# EAGLE design pager pcb (EAGLE 6.4)
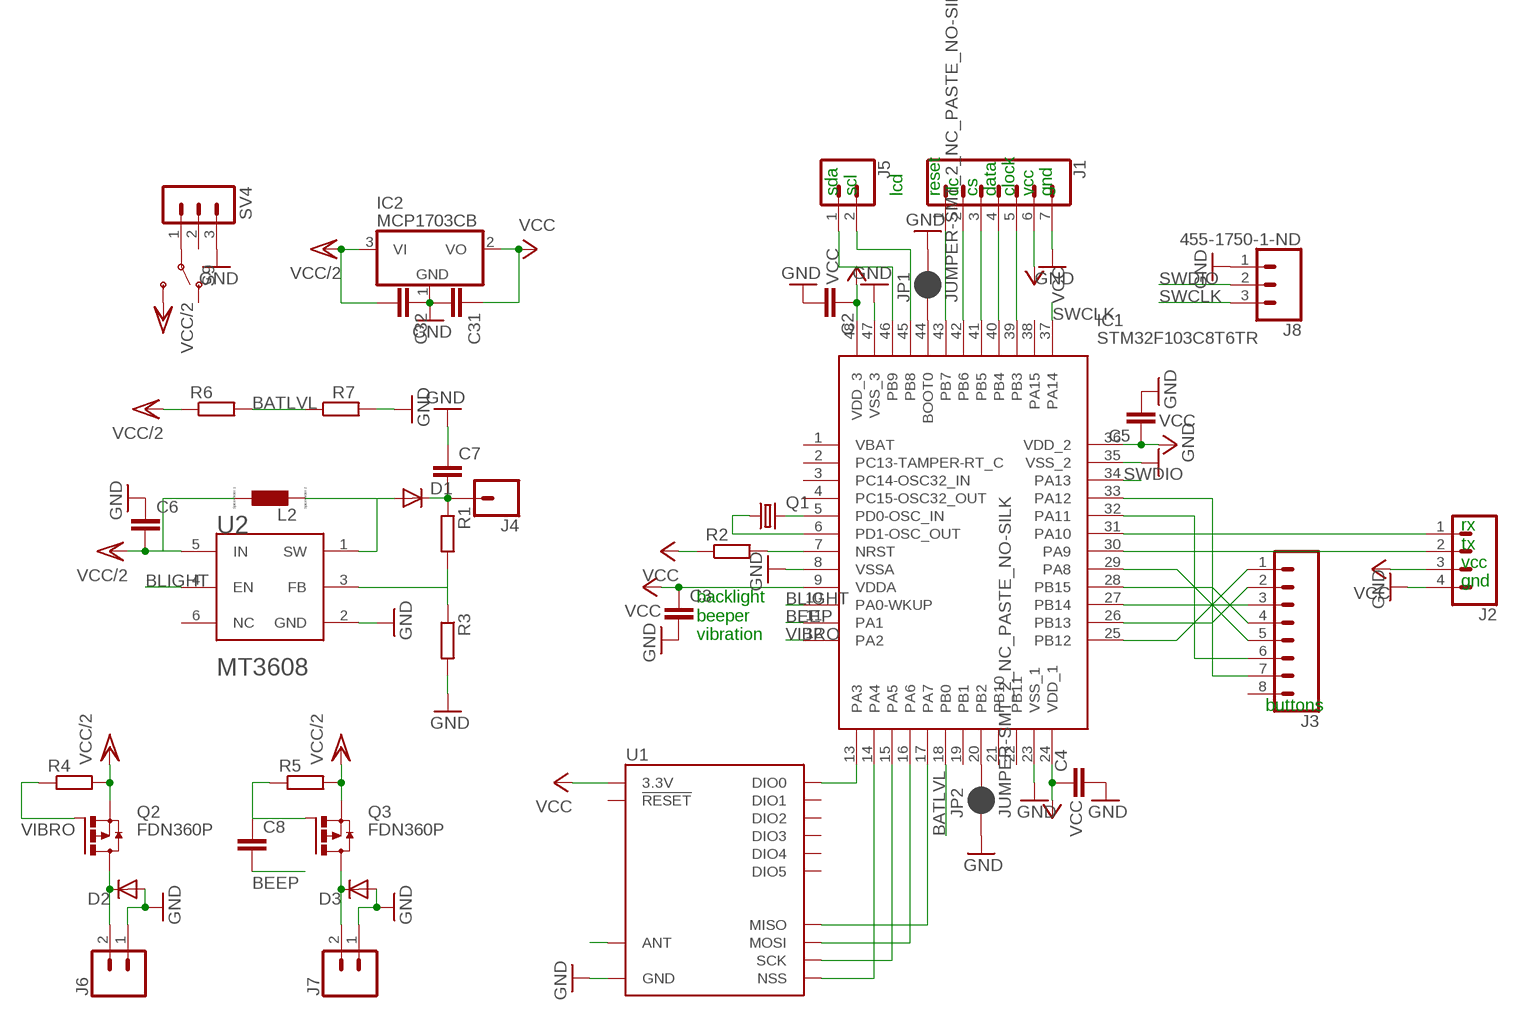
[diagram p0: schematic, sheet 1]

## Parts
C2  C-EUC0805  [C0805]
C3  C-EUC0805  [C0805]
C4  C-EUC0805  [C0805]
C5  C-EUC0805  [C0805]
C6  C-EUC0805  [C0805]
C7  C-EUC0805  [C0805]
C8  C-EUC0805  [C0805]
C31  C-EUC0805  [C0805]
C32  C-EUC0805  [C0805]
D1  DIODE-DO-214AC  [DO-214AC]
D2  DIODE-DO-214AC  [DO-214AC]
D3  DIODE-DO-214AC  [DO-214AC]
IC1  STM32F103C8T6TR  [QFP50P900X900X160-48N]
IC2  MCP1703CB  [SOT23]
J1  CONN_07  [1X07]
J2  CONN_04PTH  [1X04]
J3  CONN_08"  [1X08]
J4  CONN_01  [1X01]
J5  CONN_02  [1X02]
J6  CONN_02  [1X02]
J7  CONN_02  [1X02]
J8  455-1750-1-ND  CONN_03  [1X03]
JP1  JUMPER-SMT_2_NC_PASTE_NO-SILK  [SMT-JUMPER_2_NC_PASTE_NO-SILK]
JP2  JUMPER-SMT_2_NC_PASTE_NO-SILK  [SMT-JUMPER_2_NC_PASTE_NO-SILK]
L2  L0207/10  [0207/10]
Q1  CRYSTALCTS406  [CTS406]
Q2  FDN360P  [SUPER-SOT3]
Q3  FDN360P  [SUPER-SOT3]
R1  R-EU_M0805  [M0805]
R2  R-EU_M0805  [M0805]
R3  R-EU_M0805  [M0805]
R4  R-EU_M0805  [M0805]
R5  R-EU_M0805  [M0805]
R6  R-EU_M0805  [M0805]
R7  R-EU_M0805  [M0805]
S9  SWITCH-SPDT-SMD-RIGHT-ANGLE  [SWITCH_SPST_SMD_A]
SV4  MA03-1  [MA03-1]
U1  RFM95W  [RFM95/96/97/98W]
U2  AEROSEMI_TECHNOLOGY_CO.,_LTD_MT3608AEROSEMI_TECHNOLOGY_CO.,_LTD_MT3608_0_0  [AEROSEMI_TECHNOLOGY_CO.,_LTD_MT3608_0]

## Nets
BATLVL: IC1.18(PB0) R6.2 R7.1
BEEP: C8.2 IC1.11(PA1)
BLIGHT: IC1.10(PA0-WKUP) U2.4(EN)
GND: C2.2 C3.2 C4.2 C5.2 C6.1 C7.1 C31.2 C32.1 D2.A D3.A IC1.8(VSSA) IC1.23(VSS_1) IC1.35(VSS_2) IC1.47(VSS_3) IC2.1(GND) J1.7 J2.4 J6.1 J7.1 J8.1 JP1.2 JP2.1 R3.2 R7.2 SV4.3 U1.GND@1(GND) U1.GND@2(GND) U1.GND@3(GND) U2.2(GND)
N$1: IC1.5(PD0-OSC_IN) Q1.3
N$2: IC1.6(PD1-OSC_OUT) Q1.1
N$3: IC1.7(NRST) R2.2
N$4: IC1.44(BOOT0) JP1.1
N$5: IC1.20(PB2) JP2.2
N$6: IC1.43(PB7) J1.1
N$7: IC1.42(PB6) J1.2
N$8: IC1.41(PB5) J1.3
N$9: IC1.40(PB4) J1.4
N$10: IC1.39(PB3) J1.5
N$11: IC1.31(PA10) J2.1
N$12: IC1.30(PA9) J2.2
N$13: IC1.17(PA7) U1.MISO
N$14: IC1.16(PA6) U1.MOSI
N$15: IC1.15(PA5) U1.SCK
N$16: IC1.14(PA4) U1.NSS
N$17: IC1.13(PA3) U1.DIO0
N$18: IC1.25(PB12) J3.1
N$19: IC1.26(PB13) J3.2
N$20: IC1.27(PB14) J3.3
N$21: IC1.28(PB15) J3.4
N$22: IC1.29(PA8) J3.5
N$24: IC1.33(PA12) J3.7
N$25: IC1.32(PA11) J3.6
N$26: D2.C J6.2 Q2.3(D)
N$27: U1.ANT
N$28: D3.C J7.2 Q3.3(D)
N$29: IC1.46(PB9) J5.1
N$30: IC1.45(PB8) J5.2
N$31: S9.2(P) SV4.1
N$32: D1.A L2.2 U2.1(SW)
N$33: C7.2 D1.C J4.1 R1.1
N$34: C8.1 Q3.1(G) R5.1
N$36: R1.2 R3.1 U2.3(FB)
SWCLK: IC1.37(PA14) J8.3
SWDIO: IC1.34(PA13) J8.2
VCC: C2.1 C3.1 C4.1 C5.1 C31.1 IC1.9(VDDA) IC1.24(VDD_1) IC1.36(VDD_2) IC1.48(VDD_3) IC2.2(VO) J1.6 J2.3 R2.1 U1.3.3V
VCC/2: C6.2 C32.2 IC2.3(VI) L2.1 Q2.2(S) Q3.2(S) R4.2 R5.2 R6.1 S9.3(S) U2.5(IN)
VIBRO: IC1.12(PA2) Q2.1(G) R4.1
Unconnected: IC1.1(VBAT) IC1.2(PC13-TAMPER-RT_C) IC1.3(PC14-OSC32_IN) IC1.4(PC15-OSC32_OUT) IC1.19(PB1) IC1.21(PB10) IC1.22(PB11) IC1.38(PA15) J3.8 S9.1(O) SV4.2 U1.!RESET U1.DIO1 U1.DIO2 U1.DIO3 U1.DIO4 U1.DIO5 U2.6(NC)

## Notes on the sheet
- sda
  scl
- lcd
  
  reset
  dc
  cs
  data
  clock
  vcc
  gnd
- rx
  tx
  vcc
  gnd
- backlight
  beeper
  vibration
- buttons

## Library data of the parts
C2-C8 C31 C32 = resistor:C-EU: CAPACITOR, European symbol
D1-D3 = diode:DIODE-: DIODE
IC1 = SamacSys_Parts:STM32F103C8T6TR: ARM Microcontrollers - MCU 32BIT Cortex M3 USB 7 TIMERS 2 ADCS CAN Source: Datasheet <http://media.digikey.com/pdf/Data Sheets/ST Microelectronics PDFS/STM32F103x8,B.pdf>; DESCRIPTION: ARM Microcontrollers - MCU 32BIT Cortex M3 USB 7 TIMERS 2 ADCS CAN; HEIGHT: 1.6mm; MANUFACTURER_NAME: STMicroelectronics; MANUFACTURER_PART_NUMBER: STM32F103C8T6TR; MOUSER_PART_NUMBER: 511-STM32F103C8T6TR; MOUSER_PRICE-STOCK: https://www.mouser.co.uk/ProductDetail/STMicroelectronics/STM32F103C8T6TR?qs=5HwTSiuA5HDxFj62n06yag%3D%3D
IC2 = linear:MCP1703: 250 mA, 16V, Low Quiescent Current LDO Regulator Source: http://ww1.microchip.com/downloads/en/DeviceDoc/22049b.pdf
J1 = SparkFun-Connectors:CONN_07: Multi connection point. Often used as Generic Header-pin footprint for 0.1 inch spaced/style header connections On any of the 0.1 inch spaced packages, you can populate with these: Break Away Headers - Straight <https://www.sparkfun.com/products/116> (PRT-00116) Break Away Male Headers - Right Angle <https://www.sparkfun.com/products/553> (PRT-00553) Female Headers <https://www.sparkfun.com/products/115> (PRT-00115) Break Away Headers - Machine Pin <https://www.sparkfun.com/products/117> (PRT-00117) Break Away Female Headers - Swiss Machine Pin <https://www.sparkfun.com/products/743> (PRT-00743) For SCREWTERMINALS and SPRING TERMINALS visit here: Screw Terimnals on SparkFun.com <https://www.sparkfun.com/search/results?term=Screw+Terminals> (5mm/3.5mm/2.54mm spacing) This device is also useful as a general connection point to wire up your design to another part of your project. Our various solder wires solder well into these plated through hole pads. Hook-Up Wire - Assortment (Stranded, 22 AWG) <https://www.sparkfun.com/products/11375> (PRT-11375) Hook-Up Wire - Assortment (Solid Core, 22 AWG) <https://www.sparkfun.com/products/11367> (PRT-11367) View the entire wire category on our website here <https://www.sparkfun.com/categories/141> Special notes: Molex polarized connector foot print use with SKU : PRT-08231 with associated crimp pins and housings. 1MM SMD Version SKU: PRT-10208 NOTES ON THE VARIANTS LOCK and LOCK_LONGPADS... This footprint was designed to help hold the alignment of a through-hole component (i.e. 6-pin header) while soldering it into place. You may notice that each hole has been shifted either up or down by 0.005 of an inch from it's more standard position (which is a perfectly straight line). This slight alteration caused the pins (the squares in the middle) to touch the edges of the holes. Because they are alternating, it causes a "brace" to hold the component in place. 0.005 has proven to be the perfect amount of "off-center" position when using our standard breakaway headers. Although looks a little odd when you look at the bare footprint, once you have a header in there, the alteration is very hard to notice. Also,if you push a header all the way into place, it is covered up entirely on the bottom side.
J2 = SparkFun-Connectors:CONN_04: Multi connection point. Often used as Generic Header-pin footprint for 0.1 inch spaced/style header connections On any of the 0.1 inch spaced packages, you can populate with these: Break Away Headers - Straight <https://www.sparkfun.com/products/116> (PRT-00116) Break Away Male Headers - Right Angle <https://www.sparkfun.com/products/553> (PRT-00553) Female Headers <https://www.sparkfun.com/products/115> (PRT-00115) Break Away Headers - Machine Pin <https://www.sparkfun.com/products/117> (PRT-00117) Break Away Female Headers - Swiss Machine Pin <https://www.sparkfun.com/products/743> (PRT-00743) For SCREWTERMINALS and SPRING TERMINALS visit here: Screw Terimnals on SparkFun.com <https://www.sparkfun.com/search/results?term=Screw+Terminals> (5mm/3.5mm/2.54mm spacing) This device is also useful as a general connection point to wire up your design to another part of your project. Our various solder wires solder well into these plated through hole pads. Hook-Up Wire - Assortment (Stranded, 22 AWG) <https://www.sparkfun.com/products/11375> (PRT-11375) Hook-Up Wire - Assortment (Solid Core, 22 AWG) <https://www.sparkfun.com/products/11367> (PRT-11367) View the entire wire category on our website here <https://www.sparkfun.com/categories/141> Special notes: Molex polarized connector foot print use with SKU : PRT-08231 with associated crimp pins and housings. 1MM SMD Version SKU: PRT-10208; PROD_ID: CONN-09696
J3 = SparkFun-Connectors:CONN_08: Multi connection point. Often used as Generic Header-pin footprint for 0.1 inch spaced/style header connections On any of the 0.1 inch spaced packages, you can populate with these: Break Away Headers - Straight <https://www.sparkfun.com/products/116> (PRT-00116) Break Away Male Headers - Right Angle <https://www.sparkfun.com/products/553> (PRT-00553) Female Headers <https://www.sparkfun.com/products/115> (PRT-00115) Break Away Headers - Machine Pin <https://www.sparkfun.com/products/117> (PRT-00117) Break Away Female Headers - Swiss Machine Pin <https://www.sparkfun.com/products/743> (PRT-00743) Arduino Stackable Header - 8 Pin <https://www.sparkfun.com/products/9279> (PRT-09279) For SCREWTERMINALS and SPRING TERMINALS visit here: Screw Terimnals on SparkFun.com <https://www.sparkfun.com/search/results?term=Screw+Terminals> (5mm/3.5mm/2.54mm spacing) This device is also useful as a general connection point to wire up your design to another part of your project. Our various solder wires solder well into these plated through hole pads. Hook-Up Wire - Assortment (Stranded, 22 AWG) <https://www.sparkfun.com/products/11375> (PRT-11375) Hook-Up Wire - Assortment (Solid Core, 22 AWG) <https://www.sparkfun.com/products/11367> (PRT-11367) View the entire wire category on our website here <https://www.sparkfun.com/categories/141> Special notes: Molex polarized connector foot print use with SKU : PRT-08231 with associated crimp pins and housings. 1MM SMD Version SKU: PRT-10208 NOTES ON THE VARIANTS LOCK and LOCK_LONGPADS... This footprint was designed to help hold the alignment of a through-hole component (i.e. 6-pin header) while soldering it into place. You may notice that each hole has been shifted either up or down by 0.005 of an inch from it's more standard position (which is a perfectly straight line). This slight alteration caused the pins (the squares in the middle) to touch the edges of the holes. Because they are alternating, it causes a "brace" to hold the component in place. 0.005 has proven to be the perfect amount of "off-center" position when using our standard breakaway headers. Although looks a little odd when you look at the bare footprint, once you have a header in there, the alteration is very hard to notice. Also,if you push a header all the way into place, it is covered up entirely on the bottom side.; PROD_ID: CONN-08438
J4 = SparkFun-Connectors:CONN_01: Single connection point. Often used as Generic Header-pin footprint for 0.1 inch spaced/style header connections On any of the 0.1 inch spaced packages, you can populate with these: Break Away Headers - Straight <https://www.sparkfun.com/products/116> (PRT-00116) Break Away Male Headers - Right Angle <https://www.sparkfun.com/products/553> (PRT-00553) Female Headers <https://www.sparkfun.com/products/115> (PRT-00115) Break Away Headers - Machine Pin <https://www.sparkfun.com/products/117> (PRT-00117) Break Away Female Headers - Swiss Machine Pin <https://www.sparkfun.com/products/743> (PRT-00743) This device is also useful as a general connection point to wire up your design to another part of your project. Our various solder wires solder well into these plated through hole pads. Hook-Up Wire - Assortment (Stranded, 22 AWG) <https://www.sparkfun.com/products/11375> (PRT-11375) Hook-Up Wire - Assortment (Solid Core, 22 AWG) <https://www.sparkfun.com/products/11367> (PRT-11367) View the entire wire category on our website here <https://www.sparkfun.com/categories/141> Special notes: SMTSO-256-ET is a "flush mount" nut for a 4-40 screw. We mostly use this on specialty testbeds; it is a nice way to connect hardware to your PCB at an adjustable hieght. Also note, the SNAP packages are for using a snappable style connector. We sell a baggie of snaps and they are also used on two LilyPad designs: Snap Assortment - 30 pack (male and female) <https://www.sparkfun.com/products/11347> (DEV-11347) LilyPad Arduino SimpleSnap <https://www.sparkfun.com/products/10941> (DEV-10941) LilyPad SimpleSnap Protoboard <https://www.sparkfun.com/products/10940> (DEV-10940)
J5-J7 = SparkFun-Connectors:CONN_02: Multi connection point. Often used as Generic Header-pin footprint for 0.1 inch spaced/style header connections On any of the 0.1 inch spaced packages, you can populate with these: Break Away Headers - Straight <https://www.sparkfun.com/products/116> (PRT-00116) Break Away Male Headers - Right Angle <https://www.sparkfun.com/products/553> (PRT-00553) Female Headers <https://www.sparkfun.com/products/115> (PRT-00115) Break Away Headers - Machine Pin <https://www.sparkfun.com/products/117> (PRT-00117) Break Away Female Headers - Swiss Machine Pin <https://www.sparkfun.com/products/743> (PRT-00743) For SCREWTERMINALS and SPRING TERMINALS visit here: Screw Terimnals on SparkFun.com <https://www.sparkfun.com/search/results?term=Screw+Terminals> (5mm/3.5mm/2.54mm spacing) This device is also useful as a general connection point to wire up your design to another part of your project. Our various solder wires solder well into these plated through hole pads. Hook-Up Wire - Assortment (Stranded, 22 AWG) <https://www.sparkfun.com/products/11375> (PRT-11375) Hook-Up Wire - Assortment (Solid Core, 22 AWG) <https://www.sparkfun.com/products/11367> (PRT-11367) View the entire wire category on our website here <https://www.sparkfun.com/categories/141> Special notes: Molex polarized connector foot print use with: PRT-08233 with associated crimp pins and housings. 2.54_SCREWTERM for use with PRT-10571. 3.5mm Screw Terminal footprints for PRT-08084 5mm Screw Terminal footprints for use with PRT-08432
J8 = SparkFun-Connectors:CONN_03: Multi connection point. Often used as Generic Header-pin footprint for 0.1 inch spaced/style header connections On any of the 0.1 inch spaced packages, you can populate with these: Break Away Headers - Straight <https://www.sparkfun.com/products/116> (PRT-00116) Break Away Male Headers - Right Angle <https://www.sparkfun.com/products/553> (PRT-00553) Female Headers <https://www.sparkfun.com/products/115> (PRT-00115) Break Away Headers - Machine Pin <https://www.sparkfun.com/products/117> (PRT-00117) Break Away Female Headers - Swiss Machine Pin <https://www.sparkfun.com/products/743> (PRT-00743) Stackable Header - 3 Pin (Female, 0.1") <https://www.sparkfun.com/products/13875> (PRT-13875) For SCREWTERMINALS and SPRING TERMINALS visit here: Screw Terimnals on SparkFun.com <https://www.sparkfun.com/search/results?term=Screw+Terminals> (5mm/3.5mm/2.54mm spacing) This device is also useful as a general connection point to wire up your design to another part of your project. Our various solder wires solder well into these plated through hole pads. Hook-Up Wire - Assortment (Stranded, 22 AWG) <https://www.sparkfun.com/products/11375> (PRT-11375) Hook-Up Wire - Assortment (Solid Core, 22 AWG) <https://www.sparkfun.com/products/11367> (PRT-11367) View the entire wire category on our website here <https://www.sparkfun.com/categories/141> Special notes: Molex polarized connector foot print use with SKU : PRT-08232 with associated crimp pins and housings.; PROD_ID: XXX-00000
JP1 JP2 = SparkFun-Jumpers:JUMPER-SMT_2_NC_PASTE: Normally closed solder jumper This jumper has an aperture in the stencil to allow solder paste to bridge the split in the wire so it's normally closed (NC). Wick off the solder to open the connection. Reapply solder to reclose the connection.
L2 = eagle-ltspice:L: INDUCTOR, European symbol; SPICEMODEL: NONE; SPICEPREFIX: L
Q1 = crystal:CRYSTAL: CRYSTAL; OC_FARNELL: unknown; OC_NEWARK: unknown
Q2 Q3 = transistor-power:FDN360P: Single P-Channel, PowerTrench (R) MOSFET Source: http://www.fairchildsemi.com/ds/FD/FDN360P.pdf
R1-R7 = rcl:R-EU_: RESISTOR, European symbol
S9 = SparkFun-Switches:SWITCH-SPDT: Single Pole, Double Throw (SPDT) Switch Single-pole, double-throw (SPDT) switch. Variant Overview SMD-AYZ0202 Surface Mount DPDT Switch <https://www.sparkfun.com/products/597> (COM-00597) Used on e.g. LilyPad Arduino USB - ATmega32U4 Board <https://www.sparkfun.com/products/12049> PTH-11.6X4.0MM SPDT Mini Power Switch <https://www.sparkfun.com/products/102> (COM-00102) Used on e.g. SparkFun Simon Says - Through-Hole Soldering Kit <https://www.sparkfun.com/products/10547> (KIT-10547) PTH-11.6X4.0MM-KIT KIT version of SPDT Mini Power Switch - Simplifies soldering by removing tStop of switch pins - only one side can be soldered. PTH-11.6X4.0MM-LOCK LOCK version of SPDT Mini Power Switch - Offset pins hold switch in place for easier soldering. SMD-RIGHT-ANGLE Surface Mount Right Angle Switch <https://www.sparkfun.com/products/10860> (COM-10860) Used on e.g. SparkFun ESP8266 Thing <https://www.sparkfun.com/products/13231>; PROD_ID: SWCH-10651; SF_SKU: COM-10860
SV4 = con-lstb:MA03-1: PIN HEADER; OC_FARNELL: unknown; OC_NEWARK: unknown
U1 = SparkFun-RF:RFM95W: RFM95/96/97/98 The RFM95/96/97/98(W) transceivers feature the LoRaTM long range modem that provides ultra-long range spread spectrum communication and high interference immunity whilst minimising current consumption. These devices also support high performance (G)FSK modes for systems including WMBus, IEEE802.15.4g. The RFM95/96/97/98(W) deliver exceptional phase noise, selectivity, receiver linearity and IIP3 for significantly lower current consumption than competing devices Datasheet <http://www.hoperf.com/upload/rf/RFM95_96_97_98W.pdf>; PROD_ID: IC-13959
U2 = Aerosemi Technology Co., Ltd - MT3608:AEROSEMI_TECHNOLOGY_CO.,_LTD_MT3608: High Efficiency 1.2MHz 2A Step Up Converter; CENTROID_NOT_SPECIFIED: No; DATASHEET: https://www.olimex.com/Products/Breadboarding/BB-PWR-3608/resources/MT3608.pdf; DEVICE_CLASS_L1: Integrated Circuits (ICs); DEVICE_CLASS_L2: Power Management ICs; DEVICE_CLASS_L3: Voltage Regulators - Switching; HEIGHT: 1.45mm; MAX_DUTY_CYCLE: 90%; MAX_JUNCTION_TEMP: +160°C; MAX_SUPPLY_VOLTAGE: 24V; MF: Aerosemi Technology Co., Ltd; MFG_PACKAGE_IDENT: MT3608; MFG_PACKAGE_IDENT_DATE: 0; MFG_PACKAGE_IDENT_REV: 0; MIN_SUPPLY_VOLTAGE: 2V; MPN: MT3608; NUMBER_OF_OUTPUTS: 1; OUTPUT_CURRENT: 2A; PACKAGE: SOT23-6; PREFIX: U; STANDOFF_HEIGHT: 0mm; SWITCHING_FREQUENCY: 1.2MHz; SWITCHING_TOPOLOGY: Boost; TEMPERATURE_RANGE_HIGH: +85°C; TEMPERATURE_RANGE_LOW: -40°C; VERIFICATION_VERSION: 0.0.0.1

## Board
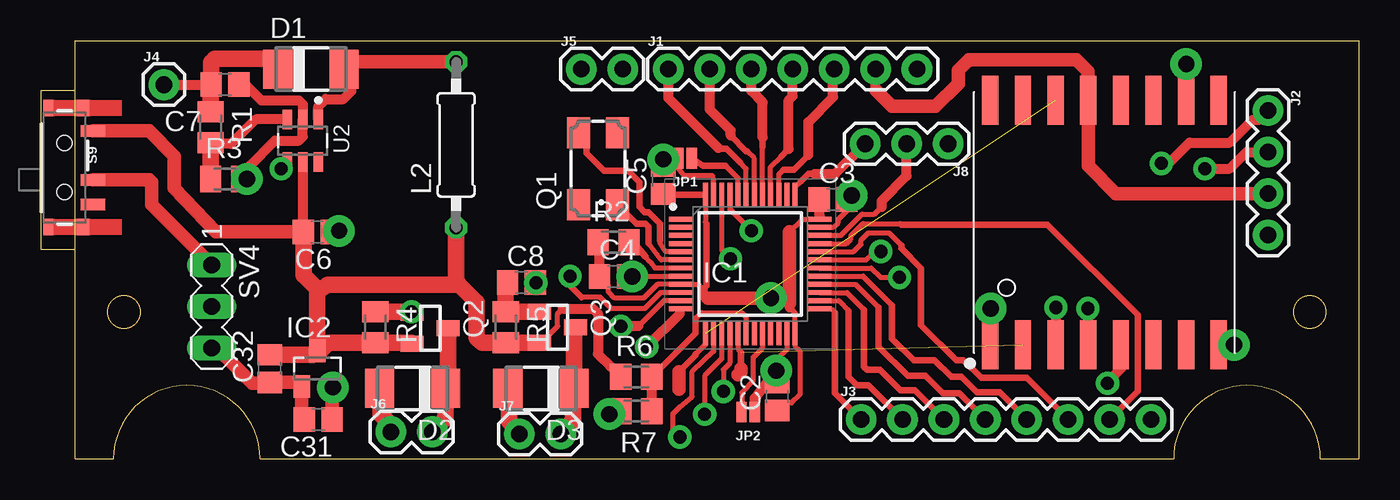
[diagram p1: board, top side]
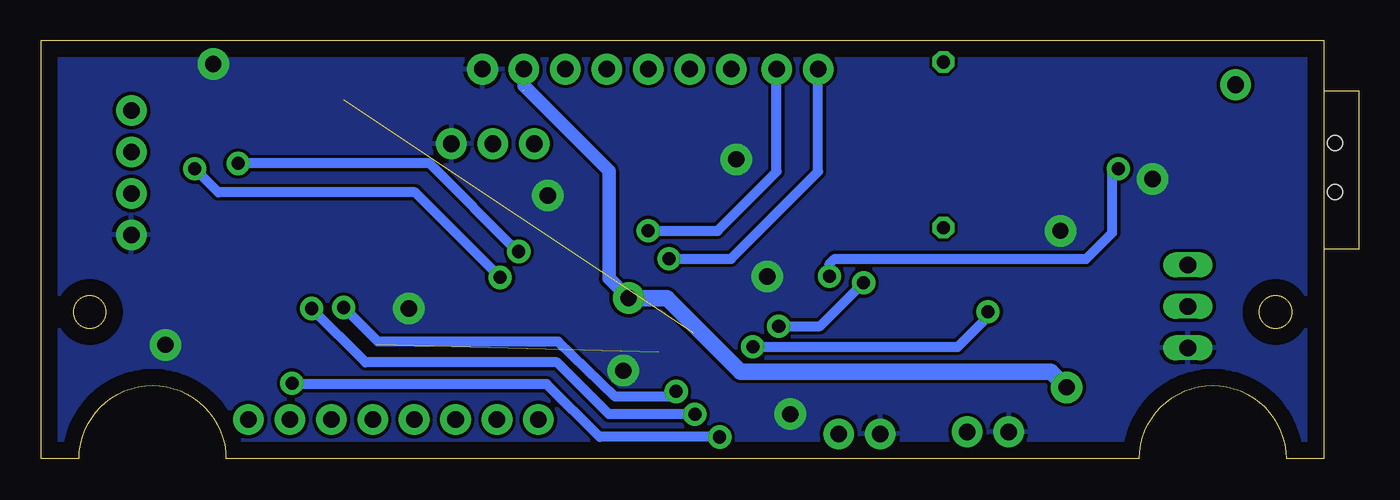
[diagram p2: board, bottom side, seen from below]

Size 80.8 x 25.62 mm. Coordinates in mm from the lower left corner, seen from the top.
Outline: 2.1,22.55 0,22.55 0,12.83 2.1,12.83
Outline: 2.1,0 4.45,0 arc-180 13.45,0 69.45,0 arc-180 78.45,0 80.8,0 80.8,25.62 2.1,25.62 2.1,0
Outline: circle at 5.1,9 radius 1
Outline: circle at 77.8,9 radius 1
Copper layers (1*16): Top 0.035mm / dielectric 1.5mm / Bottom 0.035mm
Design rules "default": minimum track width 10mil, minimum drill 24mil, track to track 8mil, track to pad 8mil, pad to pad 8mil, via to via 8mil, smd to smd 8mil, copper to edge 40mil, drill to drill 8mil, minimum pad ring 10mil, minimum via ring 8mil, stop-mask expansion 4mil, vias tented up to drill 0mil, thermal gap 10mil

### Footprints (pad centres in the part's own frame; a part is rotated, then mirrored left to right if it is on the bottom)
C0805 = smd 1.3 x 1.5: 1 -0.85,0; 2 0.85,0
DO-214AC = smd 1.8 x 2.4: A 2.025,0; C -2.025,0
QFP50P900X900X160-48N = smd 1.475 x 0.3: 1 -4.238,2.75; 2 -4.238,2.25; 3 -4.238,1.75; 4 -4.238,1.25; 5 -4.238,0.75; 6 -4.238,0.25; 7 -4.238,-0.25; 8 -4.238,-0.75; 9 -4.238,-1.25; 10 -4.238,-1.75; 11 -4.238,-2.25; 12 -4.238,-2.75; 25 4.238,-2.75; 26 4.238,-2.25; 27 4.238,-1.75; 28 4.238,-1.25; 29 4.238,-0.75; 30 4.238,-0.25; 31 4.238,0.25; 32 4.238,0.75; 33 4.238,1.25; 34 4.238,1.75; 35 4.238,2.25; 36 4.238,2.75 | smd 0.3 x 1.475: 13 -2.75,-4.238; 14 -2.25,-4.238; 15 -1.75,-4.238; 16 -1.25,-4.238; 17 -0.75,-4.238; 18 -0.25,-4.238; 19 0.25,-4.238; 20 0.75,-4.238; 21 1.25,-4.238; 22 1.75,-4.238; 23 2.25,-4.238; 24 2.75,-4.238; 37 2.75,4.238; 38 2.25,4.238; 39 1.75,4.238; 40 1.25,4.238; 41 0.75,4.238; 42 0.25,4.238; 43 -0.25,4.238; 44 -0.75,4.238; 45 -1.25,4.238; 46 -1.75,4.238; 47 -2.25,4.238; 48 -2.75,4.238
SOT23 = smd 1 x 1.4: 1 -0.95,-1.1; 2 0.95,-1.1; 3 0,1.1
1X07 = drill 1.016 pad 1.88: 1 0,0; 2 2.54,0; 3 5.08,0; 4 7.62,0; 5 10.16,0; 6 12.7,0; 7 15.24,0
1X04 = drill 1.016 pad 1.88: 1 0,0; 2 2.54,0; 3 5.08,0; 4 7.62,0
1X08 = drill 1.016 pad 1.88: 1 0,0; 2 2.54,0; 3 5.08,0; 4 7.62,0; 5 10.16,0; 6 12.7,0; 7 15.24,0; 8 17.78,0
1X01 = drill 1.016 pad 1.88: 1 0,0
1X02 = drill 1.016 pad 1.88: 1 0,0; 2 2.54,0
1X03 = drill 1.016 pad 1.88: 1 0,0; 2 2.54,0; 3 5.08,0
SMT-JUMPER_2_NC_PASTE_NO-SILK = smd 0.635 x 1.27: 1 -0.406,0; 2 0.406,0
0207/10 = drill 0.813 octagon: 1 -5.08,0; 2 5.08,0
CTS406 = smd 1.9 x 1.4: 1 -2.2,-1.2; 2 2.2,-1.2; 3 2.2,1.2; 4 -2.2,1.2
SUPER-SOT3 = smd 1 x 1.4: 1 -0.95,-1.1; 2 0.95,-1.1; 3 0,1.1
M0805 = smd 1.3 x 1.6: 1 -0.95,0; 2 0.95,0
SWITCH_SPST_SMD_A = smd 0.7 x 1.5: 1 -2.25,-1.75; 2 -0.75,-1.75; 3 2.25,-1.75 | smd 1 x 0.6: GND1 -3.65,1; GND3 3.65,1 | smd 1 x 0.8: GND2 -3.65,-1.1; GND4 3.65,-1.1 | hole 0.9: -1.5,0; 1.5,0
MA03-1 = drill 1.016 long: 1 -2.54,0; 2 0,0; 3 2.54,0
RFM95/96/97/98W = smd 3 x 1: 3.3V 7.5,1; !RESET -7.5,-3; ANT 7.5,-7; DIO0 7.5,3; DIO1 7.5,5; DIO2 7.5,7; DIO3 7.5,-3; DIO4 7.5,-1; DIO5 -7.5,-5; GND@1 -7.5,7; GND@2 -7.5,-7; GND@3 7.5,-5; MISO -7.5,5; MOSI -7.5,3; NSS -7.5,-1; SCK -7.5,1
AEROSEMI_TECHNOLOGY_CO.,_LTD_MT3608_0 = smd 0.6 x 1.2: 1 -0.95,-1.3; 2 0,-1.3; 3 0.95,-1.3; 4 0.95,1.3; 5 0,1.3; 6 -0.95,1.3

### Placement (x,y rotation side)
C2  45.15,3.81 90 top
C3  48.58,15.88 0 top
C4  35.12,11.18 0 top
C5  38.16,17.09 90 top
C6  16.95,13.91 180 top
C7  11.3,22.93 180 top
C8  29.46,10.8 0 top
C31  17.02,2.42 180 top
C32  14.03,5.53 90 top
D1  16.57,23.88 0 top
D2  22.8,4.32 180 top
D3  30.67,4.32 180 top
IC1  43.5,11.94 0 top
IC2  16.95,5.53 0 top
J1  38.48,23.88 0 top
J2  75.25,21.34 270 top
J3  50.29,2.42 0 top
J4  7.56,22.93 0 top
J5  33.15,23.88 0 top
J6  21.46,1.66 0 top
J7  29.34,1.53 0 top
J8  55.63,19.31 180 top
JP1  39.5,18.42 180 top
JP2  43.37,2.86 180 top
L2  25.46,19.24 90 top
Q1  34.16,17.78 90 top
Q2  23.88,8.01 270 top
Q3  31.69,8.07 270 top
R1  10.41,20.32 270 top
R2  35.12,13.28 0 top
R3  11.37,17.15 0 top
R4  20.51,8.07 270 top
R5  28.51,8.07 270 top
R6  36.51,5.02 0 top
R7  36.51,2.93 180 top
S9  1.46,17.85 90 top
SV4  10.48,9.34 270 top
U1  65.21,14.48 90 top
U2  16.07,19.5 180 top

### Tracks (layer width: path | path; a pad name or v marks a point on that pad's centre or on a via)
BATLVL
  Top 0.305: IC1.18 43.24,8.7 42.99,8.96 40.51,8.96 40.13,8.58
  Top 0.406: 40.13,8.58 40.13,7.69 R6.2
  Top 0.61: R7.1 R6.2
BEEP  (via drill 0.8 pad 1.42)
  Top 0.305: IC1.11 38.2,9.69 36.64,8.13
  Top 0.61: 36.64,8.13 v35.56,8.13 | v30.35,10.8 30.35,10.76 C8.2
  Bottom 0.61: v35.56,8.13 33.02,8.13 v30.35,10.8
BLIGHT  (via drill 0.8 pad 1.42)
  Top 0.305: IC1.10 38,10.19 37.02,9.21 34.99,9.21 34.29,9.91 33.15,9.91
  Top 0.406: 33.15,9.91 32.45,10.61 v32.45,11.18
  Top 0.61: v14.73,17.78 14.86,17.94 U2.4
  Bottom 0.61: v32.45,11.18 32.45,11.94 32.13,12.26 16.7,12.26 15.11,13.85 15.11,17.53 v14.73,17.78
GND  (via drill 1 pad 1.93)
  Top 0.305: v36.26,11.18 39.25,11.18 IC1.8 | IC1.23 45.75,6.7 45.15,6.1 45.15,5.66 v45.09,5.4 | IC1.35 48.6,14.19 48.89,14.48 48.89,14.67 49.53,15.31 49.53,15.6 C3.2 | IC1.47 41.25,17.11 41.21,17.34 39.46,17.34 38.99,17.94
  Top 0.406: C5.2 38.99,17.94 39.07,17.94 JP1.2
  Top 0.61: v12.64,17.15 12.83,17.98 14.35,19.5 15.81,19.5 16.07,19.75 U2.2 16.07,21.72 15.81,21.98 13.53,21.98 12.57,22.93 C7.1 | v36.26,11.18 C4.2 | JP2.1 43.78,3.71 v45.09,5.4 | U1.GND@1 58.21,9.2 v58.23,9.21 | U1.GND@2 v73.15,6.98 v73.15,6.99 | v49.72,16.13 C3.2 | C5.2 v38.16,18.36
  Top 0.813: R3.2 v12.64,17.15 | C6.1 v18.29,13.97 | SV4.3 10.79,6.8 12.95,4.64 13.99,4.64 C32.1 15.75,4.68 IC2.1 16,2.58 C31.2 | R7.2 35.05,2.93 v34.86,2.73 | v45.09,5.4 C2.2
  Top 1.016: J6.1 21.46,2.1 20.83,2.73 20.83,4.27 D2.A | J7.1 29.34,1.66 28.7,2.29 28.7,4.27 D3.A | U1.GND@3 70.21,24.18 v70.23,24.2
  pour Bottom: 1.65,26.17 81.41,26.17 81.41,-0.44 1.65,-0.44
N$1
  Top 0.305: IC1.5 38.3,12.69 37.97,13.21 37.97,13.4
  Top 0.406: 37.97,13.4 37.97,14.42 37.27,15.12 37.02,15.12 36.7,15.44 36.7,16.96 36.01,17.66 34.54,17.66 33.46,18.74 33.46,19.48 Q1.3
N$2
  Top 0.305: IC1.6 38.04,12.19 37.78,12.51 37.27,13.21
  Top 0.406: 37.27,13.21 37.27,14.23 37.08,14.42 36.53,14.42 Q1.1
N$3
  Top 0.305: IC1.7 37.65,11.69 37.46,11.94 37.27,12.13 37.08,12.39
  Top 0.406: 37.08,12.39 36.58,12.96 36.38,12.96 R2.2
N$4
  Top 0.305: IC1.44 42.75,17.2 41.97,17.98
  Top 0.406: 41.97,17.98 40.6,17.98 JP1.1
N$5
  Top 0.305: IC1.20 44.25,6.79 43.69,6.23 43.69,4.83 42.99,4.07 42.99,2.89 JP2.2
N$6
  Top 0.305: IC1.43 43.25,17.78 42.86,18.16
  Top 0.406: 42.86,18.16 42.04,18.99 41.59,18.99 41.53,19.05
  Top 0.61: 41.53,19.05 38.48,22.1 J1.1
N$7
  Top 0.305: IC1.42 43.75,18.42 43.31,18.86
  Top 0.406: 43.31,18.86 43.24,18.86 42.29,19.82
  Top 0.61: 42.29,19.82 42.29,20.13 41.02,21.4 J1.2
N$8
  Top 0.305: IC1.41 44.25,19.11 44.26,19.12
  Top 0.406: 44.26,19.12 44.26,19.69
  Top 0.61: 44.26,19.69 44.26,21.85 43.56,22.55 J1.3
N$9
  Top 0.305: IC1.40 44.75,17.89 45.4,18.55
  Top 0.406: 45.4,18.55 45.85,18.99
  Top 0.61: 45.85,18.99 45.85,21.98 46.1,22.23 J1.4
N$10
  Top 0.305: IC1.39 45.25,17.44 45.53,17.72
  Top 0.406: 45.53,17.72 46.16,17.72 47.05,18.61
  Top 0.61: 47.05,18.61 47.05,20.64 48.58,22.17 48.58,23.82 J1.5
N$11  (via drill 0.8 pad 1.42)
  Top 0.305: IC1.31 50.6,12.19 50.99,12.58 51.24,12.58 v51.5,12.71
  Top 0.61: v68.71,18.1 69.15,18.1 70.42,19.37 72.9,19.37 74.3,20.77 74.68,20.77 J2.1
  Bottom 0.61: v51.5,12.71 51.56,12.71 56.96,18.1 v68.71,18.1
N$12  (via drill 0.8 pad 1.42)
  Top 0.305: IC1.30 50.92,11.69 51.5,11.12 v52.64,11.12
  Top 0.61: J2.2 73.91,18.8 72.9,17.78 v71.37,17.78
  Bottom 0.61: v52.64,11.12 57.85,16.32 69.91,16.32 v71.37,17.78
N$13  (1 unrouted)
  Top 0.305: IC1.17 42.75,6.72 42.93,6.54
  Top 0.406: 42.93,6.54 42.93,5.53
  Top 0.813: 42.93,5.53 42.93,5.34 42.74,5.15
N$14  (via drill 0.8 pad 1.42)
  Top 0.305: IC1.16 42.25,5.87 41.85,5.47 v41.85,4.13
  Top 0.61: v62.23,9.28 62.23,7 U1.MOSI
  Bottom 0.61: v41.85,4.13 41.97,3.81 45.59,3.81 49.09,7.18 60.13,7.18 v62.23,9.28
N$15  (via drill 0.8 pad 1.42)
  Top 0.305: IC1.15 41.75,6.13 40.7,5.08 v40.7,2.73
  Top 0.61: v64.2,9.21 64.2,7 U1.SCK
  Bottom 0.61: v40.7,2.73 45.97,2.73 49.15,5.91 60.9,5.91 v64.2,9.21
N$16  (via drill 0.8 pad 1.42)
  Top 0.305: IC1.14 41.25,6.58 39.94,5.34 39.94,3.81 39.18,3.18 38.73,2.73 38.73,1.78 v39.18,1.34
  Top 0.61: v65.41,4.64 65.41,4.7 66.23,5.53 66.23,6.97 U1.NSS
  Bottom 0.61: v39.18,1.34 46.55,1.34 49.78,4.58 65.34,4.58 v65.41,4.64
N$17  (1 unrouted)
  Top 0.305: IC1.13 40.75,6.97 40.68,6.97 40.13,6.42
  Top 0.406: 40.13,6.42 40.13,6.35 39.12,5.34
  Top 0.813: 39.12,5.34 39.12,4.26
N$18
  Top 0.305: IC1.25 48.47,9.19 48.7,8.96
  Top 0.406: 48.7,8.96 48.7,4.01 J3.1
N$19
  Top 0.305: IC1.26 48.92,9.69 49.53,9.08
  Top 0.406: 49.53,9.08 49.53,5.02 50.04,4.51 50.74,4.51 J3.2
N$20
  Top 0.305: IC1.27 49.44,10.19 50.48,9.15
  Top 0.406: 50.48,9.15 50.48,5.66 50.67,5.47 51.44,5.47 52.7,4.2 53.59,4.2 J3.3
N$21
  Top 0.305: IC1.28 49.95,10.69 51.37,9.28
  Top 0.406: 51.37,9.28 51.37,6.86 53.15,5.08 54.23,5.08 55.31,4.01 56.32,4.01 J3.4
N$22
  Top 0.305: IC1.29 50.41,11.19 52.2,9.4
  Top 0.406: 52.2,9.4 52.2,7.37 53.53,6.04 54.8,6.04 55.82,5.02 56.45,5.02 57.4,4.07 58.8,4.07 J3.5
N$24
  Top 0.305: IC1.33 49.38,13.19 49.66,13.47 49.66,13.66 50.42,14.42 52.7,14.42 52.77,14.36
  Top 0.406: 52.77,14.36 61.72,14.36 67.25,8.83 67.25,4.13 J3.7
N$25
  Top 0.305: IC1.32 49.84,12.69 50.29,13.15 50.29,13.4 50.74,13.85 52.01,13.85 52.77,13.09
  Top 0.406: J3.6 60.45,4.96 57.66,4.96 56.58,6.04 56.13,6.04 53.98,8.2 53.98,11.69 52.77,12.9 52.77,13.09
N$26
  Top 1.016: J6.2 24.83,2.48 D2.C 24.98,4.48 Q2.3
N$28
  Top 1.016: J7.2 31.88,1.59 32.64,2.35 32.64,4.27 D3.C 32.7,7.98 Q3.3
N$29  (via drill 0.8 pad 1.42)
  Top 0.305: IC1.46 41.75,12.8 v42.29,12.26
  Bottom 0.61: v42.29,12.26 38.48,12.26 33.15,17.59 J5.1
N$30  (via drill 0.8 pad 1.42)
  Top 0.305: IC1.45 42.25,15.29 v43.56,13.97
  Bottom 0.61: v43.56,13.97 39.31,13.97 35.69,17.59 J5.2
N$31
  Top 0.813: S9.2 6.66,17.1 6.8,16.96 6.8,15.56 SV4.1
N$32
  Top 0.61: U2.1 17.02,21.59 17.46,22.04 18.54,22.04 19.05,22.55 19.05,23.32 D1.A
  Top 0.813: D1.A 18.8,24.33 L2.2
N$33
  Top 0.61: J4.1 C7.2
  Top 1.016: R1.1 10.41,22.89 C7.2 10.45,24.3 10.67,24.52 14.93,24.52 D1.C
N$34
  Top 1.016: Q3.1 R5.1 28.51,10.7 C8.1
N$36
  Top 0.61: U2.3 13.17,20.8 11.68,19.31 10.48,19.31 R1.2
  Top 1.016: R3.1 R1.2
SWCLK
  Top 0.305: IC1.37 46.25,16.66 46.61,17.02
  Top 0.406: 46.61,17.02 47.05,17.47 47.44,17.47
  Top 0.61: 47.44,17.47 48.7,17.47 J8.3
SWDIO
  Top 0.305: IC1.34 49.06,13.69 50.35,14.99 51.12,14.99 51.56,15.44
  Top 0.61: 51.56,15.44 51.56,15.82 53.09,17.34 J8.2
VCC  (via drill 0.8 pad 1.42, 1 pad 1.93)  (1 unrouted)
  Top 0.305: C4.1 34.8,10.65 34.8,10.23 35.18,9.85 36.96,9.85 37.8,10.69 IC1.9 40.34,10.69 40.34,10.59 40.58,10.35 | C2.1 45.17,3.43 46.04,3.43 46.55,3.94 46.55,6.61 46.25,6.91 IC1.24 46.25,8.94 45.91,9.28 | 45.91,13.91 46.69,14.69 IC1.36 47.74,14.91 47.75,14.93 | 40.58,16.2 40.59,16.18 IC1.48 40.75,14.5 40.83,14.42
  Top 0.406: 40.58,16.2 38.2,16.2 C5.1 | 40.83,14.42 40.83,10.61 40.58,10.35
  Top 0.61: C4.1 34.27,13.18 R2.1 | 45.91,9.28 45.91,9.53 45.78,9.85 | 47.75,14.93 47.75,15.52 C3.1 | 40.58,10.35 40.58,10.04 40.89,9.85 | 51.18,22.55 J1.6
  Top 0.813: C31.1 17.87,4.39 IC2.2 | 45.91,9.53 45.91,13.91 | 40.89,9.85 v44.77,9.85 45.78,9.85 | 51.24,22.55 52.2,21.59 54.86,21.59 56.26,22.99 56.26,23.82 56.9,24.45 63.5,24.45 64.2,23.75 64.2,22 U1.3.3V 64.21,17.96 65.91,16.26 J2.3
  Top 1.016: IC2.2 v17.91,4.39
  Bottom 0.813: J1.6 51.18,22.86 45.97,17.66 45.97,11.05 v44.77,9.85
  Bottom 1.016: v17.91,4.39 18.86,5.34 37.91,5.34 42.42,9.85 v44.77,9.85
  other vias: 51.18,23.88
VCC/2
  Top 0.305: Q3.2 30.67,7.12 31.69,8.13 31.69,8.89 32,9.21
  Top 0.61: U2.5 16.07,14.84 C6.2 | R6.1 34.92,5.66 34.16,6.42 34.16,8.89 33.85,9.21 32,9.21
  Top 0.813: S9.3 6.64,20.1 8.19,18.55 8.19,16.58 10.73,13.91 C6.2
  Top 1.016: IC2.3 16.95,10.23 | 16.95,10.23 16.95,10.42 16.13,11.24 16.13,13.76 C6.2 | C32.2 16.7,6.38 IC2.3 | IC2.3 17.16,6.63 17.65,7.12 R4.2 22.71,7.12 Q2.2 | Q3.2 R5.2 27.05,7.12 26.73,7.43 26.73,9.59 25.65,10.67 25.53,10.67 | 25.53,10.67 17.59,10.67 16.95,10.23 | L2.1 25.46,10.74 25.53,10.67
VIBRO  (via drill 0.8 pad 1.42)
  Top 0.305: IC1.12 39.18,9.11
  Top 0.406: 39.18,9.11 39.18,8.89
  Top 0.61: 39.18,8.89 v37.15,6.86 | v22.73,9.02 22.67,9.02 22.1,9.02
  Top 1.016: R4.1 22.1,9.02 22.71,9.02 Q2.1
  Bottom 0.61: v37.15,6.86 24.57,6.86 22.73,8.7 v22.73,9.02
(copper drawn outside any net)
  shapes: Top area x2